# Altium schematic sheet 电机.schdoc
size 297 x 209 mm; Symbol: Drawing-Symbol_A4; Company: 嘉立创EDA; Version: V1.0; Page Size: A4; @Project Name: V4.0整合版; @Update Date: 2026-07-28; @Create Date: 2026-07-28; Device: Drawing-Symbol_A4; @Board Name: Board2; @Page Name: P1; @Create Time: 14:20:52; @Page Count: 1; @Page No: 1; @Schematic Name: Schematic2; @Update Time: 14:20:52; @Assembly Variant: Basic; Border: 1; Title Block Position: 3; Size: A4; Width: 1170; Height: 825; Region Start: 1; X Region Count: 6; Y Region Count: 4; Blade Width: 10; Title Block: 0
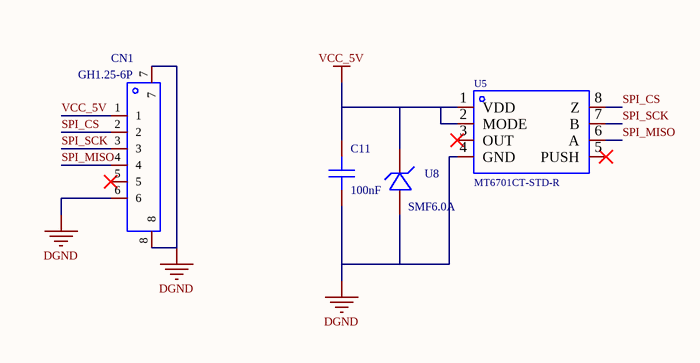
[diagram p0: 电机.schdoc]

## Parts
C11  100nF  [C0603]
CN1  GH1.25-6P  [CONN-SMD_GH1.25-6P]
U5  MT6701CT-STD-R  [SOP-8_L4.9-W3.9-P1.27-LS6.0-BL]
U8  SMF6.0A  [SOD-123FL_L2.8-W1.8-LS3.8-RD]

## Nets
DGND: C11.1 CN1.6 CN1.7 CN1.8 U5.4(GND) U8.2(A)
VCC_5V: C11.2 CN1.1 U5.1(VDD) U5.2(MODE) U8.1(C)
SPI_CS: CN1.2 U5.8(Z)
SPI_MISO: CN1.4 U5.6(A)
SPI_SCK: CN1.3 U5.7(B)

Not connected (* = marked no-connect by the designer): CN1 5*; U5 3(OUT)* 5(PUSH)*

## Notes on the sheet
- 创建日期
- 2026-07-28
- 原理图
- 板子
- Schematic2
- Board2
- 更新日期
- 图页
- P1
- 绘制
- 审阅
- V4.0整合版
- 版本
- V1.0
- 尺寸
- A4
- 页    1    共    1
- 嘉立创EDA

## Library data of the parts
C11 = CAP_0603: Symbol: Capacitance; 3D Model: ac125912035d415993ca9572d50418b10819f05c4eef4c71ace90d822a990e87; 3D Model Transform: 62.992,31.496,0,0,0,0,0,0,0; ConvertToPcb: yes; ModelName: C0603_L1.6-W0.8-H0.8; Device: CAP_0603; Supplier Footprint: 0603; Value: 100nF; AddInBom: yes; FootprintName: C0603
CN1 = GH1.25-6P: AddInBom: yes; ModelId: 9359f40e5f53415caaa6244a3307f3f90819f05c4eef4c71ace90d822a990e87; ModelTransform: 425.196,194.8815,0,0,0,0,0,-9.646,0; Symbol: GH1.25-6P; Device: GH1.25-6P; LCSC Part Name: GH1.25-6P; SupplierPart: C9900018610; ManufacturerPart: GH1.25-6P; Supplier Footprint: GH1.25-6P; JLCPCB Part Class: Extended Part; Supplier: LCSC; ConvertToPcb: yes; FootprintName: CONN-SMD_GH1.25-6P; ModelName: CONN-SMD_GH1.25-6P
U5 = MT6701CT-STD-R: 类型:磁性旋转位置传感器;接口类型:I2C；SSI;旋转角度范围:0°~360°;; Manufacturer: NOVOSENSE(纳芯微); 3D Model: 75c24a7891ee4dd6bdac16a7163ff87e0819f05c4eef4c71ace90d822a990e87; 3D Model Transform: 192.913,236.22,0,0,0,0,-0.393,2.749,0; Voltage - Supply: 3.3V~5V; Current - Supply: 10mA; Module: 否; AddInBom: yes; ModelName: SOP-8_L4.9-W3.9-P1.27-LS6.0-BL-1; Symbol: MT6701CT-STD-R; Device: MT6701CT-STD-R; LCSC Part Name: 霍尔在线编程角度位置传感器; Supplier Part: C3003196; Manufacturer Part: MT6701CT-STD-R; Supplier Footprint: SOP-8; JLCPCB Part Class: Extended Part; Datasheet: https://item.szlcsc.com/datasheet/MT6701CT-STD-R/3489938.html; Supplier: LCSC; Type: 磁性旋转位置传感器; Interface: I2C；SSI; Rotation Angle: 0°~360°; Length: 5mm; Width: 3.9mm; Height: 1.75mm; Operating Temperature: -40℃~+125℃; Features: 故障诊断；可编程传输；零位编程; ConvertToPcb: yes; FootprintName: SOP-8_L4.9-W3.9-P1.27-LS6.0-BL
U8 = SMF6.0A: 极性:单向;反向截止电压(Vrwm):6V;钳位电压:10.3V;峰值脉冲电流(Ipp):19.4A;峰值脉冲功率(Ppp):200W;击穿电压:6.67V;; Manufacturer: GOODWORK(固得沃克); Symbol: SMF6.0A_C2980406; 3D Model: c9a38256a2424d8b9727054099342ef30819f05c4eef4c71ace90d822a990e87; 3D Model Transform: 141.732,70.866,0,0,0,0,0,0,0; Polarity: 单向; Reverse Stand-Off Voltage (Vrwm): 6V; Clamping Voltage: 10.3V; Peak Pulse Current (Ipp): 19.4A; Peak Pulse Power Dissipation (Ppp): 200W; Voltage - Breakdown: 6.67V; Reverse Leakage Current (Ir): 400uA; Number of Channels: 单路; AddInBom: yes; Device: SMF6.0A; LCSC Part Name: 单向TVS 6V截止 19.4A峰值脉冲; Supplier Part: C2980406; Manufacturer Part: SMF6.0A; Supplier Footprint: SOD-123FL; JLCPCB Part Class: Extended Part; Datasheet: https://atta.szlcsc.com/upload/public/pdf/source/20240508/80D6E9463317C72355489DDC2072889A.pdf; Supplier: LCSC; Operating Temperature: -55℃~+150℃@(Tj); Type: TVS; ConvertToPcb: yes; FootprintName: SOD-123FL_L2.8-W1.8-LS3.8-RD; ModelName: SOD-123FL_L2.8-W1.8-LS3.8-RD